# Altium schematic sheet S67_07_2460.SchDoc
size A4
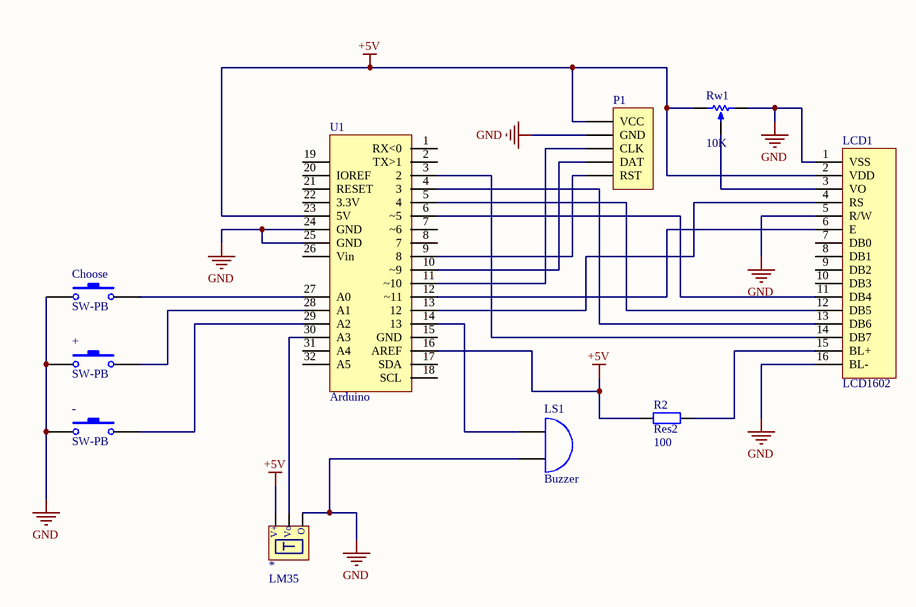
[diagram p0: S67_07_2460.SchDoc]

## Parts
*  LM35  [LM35]
+  SW-PB  [AN-S]
-  SW-PB  [AN-S]
Choose  SW-PB  [AN-S]
LCD1  LCD1602  [LCD1602]
LS1  Buzzer  [Buzzer]
P1  Header 5  [SIP-5]  (value not drawn)
R2  Res2  value 100  [AXIAL-0.4]
Rw1  value 10K  [VR5]  (hidden comment: RPot)
U1  Arduino  [Arduino-UNO]

## Nets
+5V: *.1 LCD1.2(VDD) P1.1(VCC) R2.1 Rw1.1(TOP) U1.16(AREF) U1.23(5V)
GND: *.3 +.1 -.1 Choose.1 LCD1.1(VSS) LCD1.5(R/W) LCD1.16(BL-) LS1.2(B) P1.2(GND) Rw1.3(BOT) U1.24(GND) U1.25(GND)
Net*_2: *.2 U1.30(A3)
Net+_2: +.2 U1.28(A1)
Net-_2: -.2 U1.29(A2)
NetChoose_2: Choose.2 U1.27(A0)
NetLCD1_3: LCD1.3(VO) Rw1.2(TAP)
NetLCD1_4: LCD1.4(RS) U1.13(12)
NetLCD1_6: LCD1.6(E) U1.12(~11)
NetLCD1_11: LCD1.11(DB4) U1.6(~5)
NetLCD1_12: LCD1.12(DB5) U1.5(4)
NetLCD1_13: LCD1.13(DB6) U1.4(3)
NetLCD1_14: LCD1.14(DB7) U1.3(2)
NetLCD1_15: LCD1.15(BL+) R2.2
NetLS1_1: LS1.1(A) U1.14(13)
NetP1_3: P1.3(CLK) U1.11(~10)
NetP1_4: P1.4(DAT) U1.10(~9)
NetP1_5: P1.5(RST) U1.9(8)

Not connected (* = marked no-connect by the designer): LCD1 7(DB0) 8(DB1) 9(DB2) 10(DB3); U1 1(RX<0) 2(TX>1) 7(~6) 8(7) 15(GND) 17(SDA) 18(SCL) 19 20(IOREF) 21(RESET) 22(3.3V) 26(Vin) 31(A4) 32(A5)

## Notes on the sheet
- (in symbol LM35) O; V+; Vo

## Library data of the parts
* = LM35: LM35温度传感器
+ - Choose = SW-PB: 微动开关; Published: 24-Mar-1999; LatestRevisionDate: 17-Jul-2002; LatestRevisionNote: Re-released for DXP Platform.; PackageReference: SPST-2; Publisher: Altium Limited
LCD1 = LCD1602: 液晶屏
LS1 = Bell: Electrical Bell; Published: 24-Mar-1999; LatestRevisionDate: 17-Jul-2002; LatestRevisionNote: Re-released for DXP Platform.; PackageReference: PIN2; Publisher: Altium Limited
P1 = Header 5: Header, 5-Pin; LatestRevisionDate: 17-Jul-2002; LatestRevisionNote: Re-released for DXP Platform.; Publisher: Altium Limited
R2 = Res2: Resistor; Published: 8-Jun-2000; LatestRevisionDate: 17-Jul-2002; LatestRevisionNote: Re-released for DXP Platform.; PackageReference: AXIAL-0.4; Publisher: Altium Limited
Rw1 = RPot: Potentiometer; Sim Note: Enter the Resistance value and the set point into parameter fields.; Set Position: 0.5; Published: 8-Jun-2000; LatestRevisionDate: 17-Jul-2002; LatestRevisionNote: Re-released for DXP Platform.; PackageReference: VR5; Publisher: Altium Limited
U1 = Arduino-UNO